# EasyEDA Pro project climbsnail-spotwelder-45c7d2f7.epro, board 大号mos板_8管
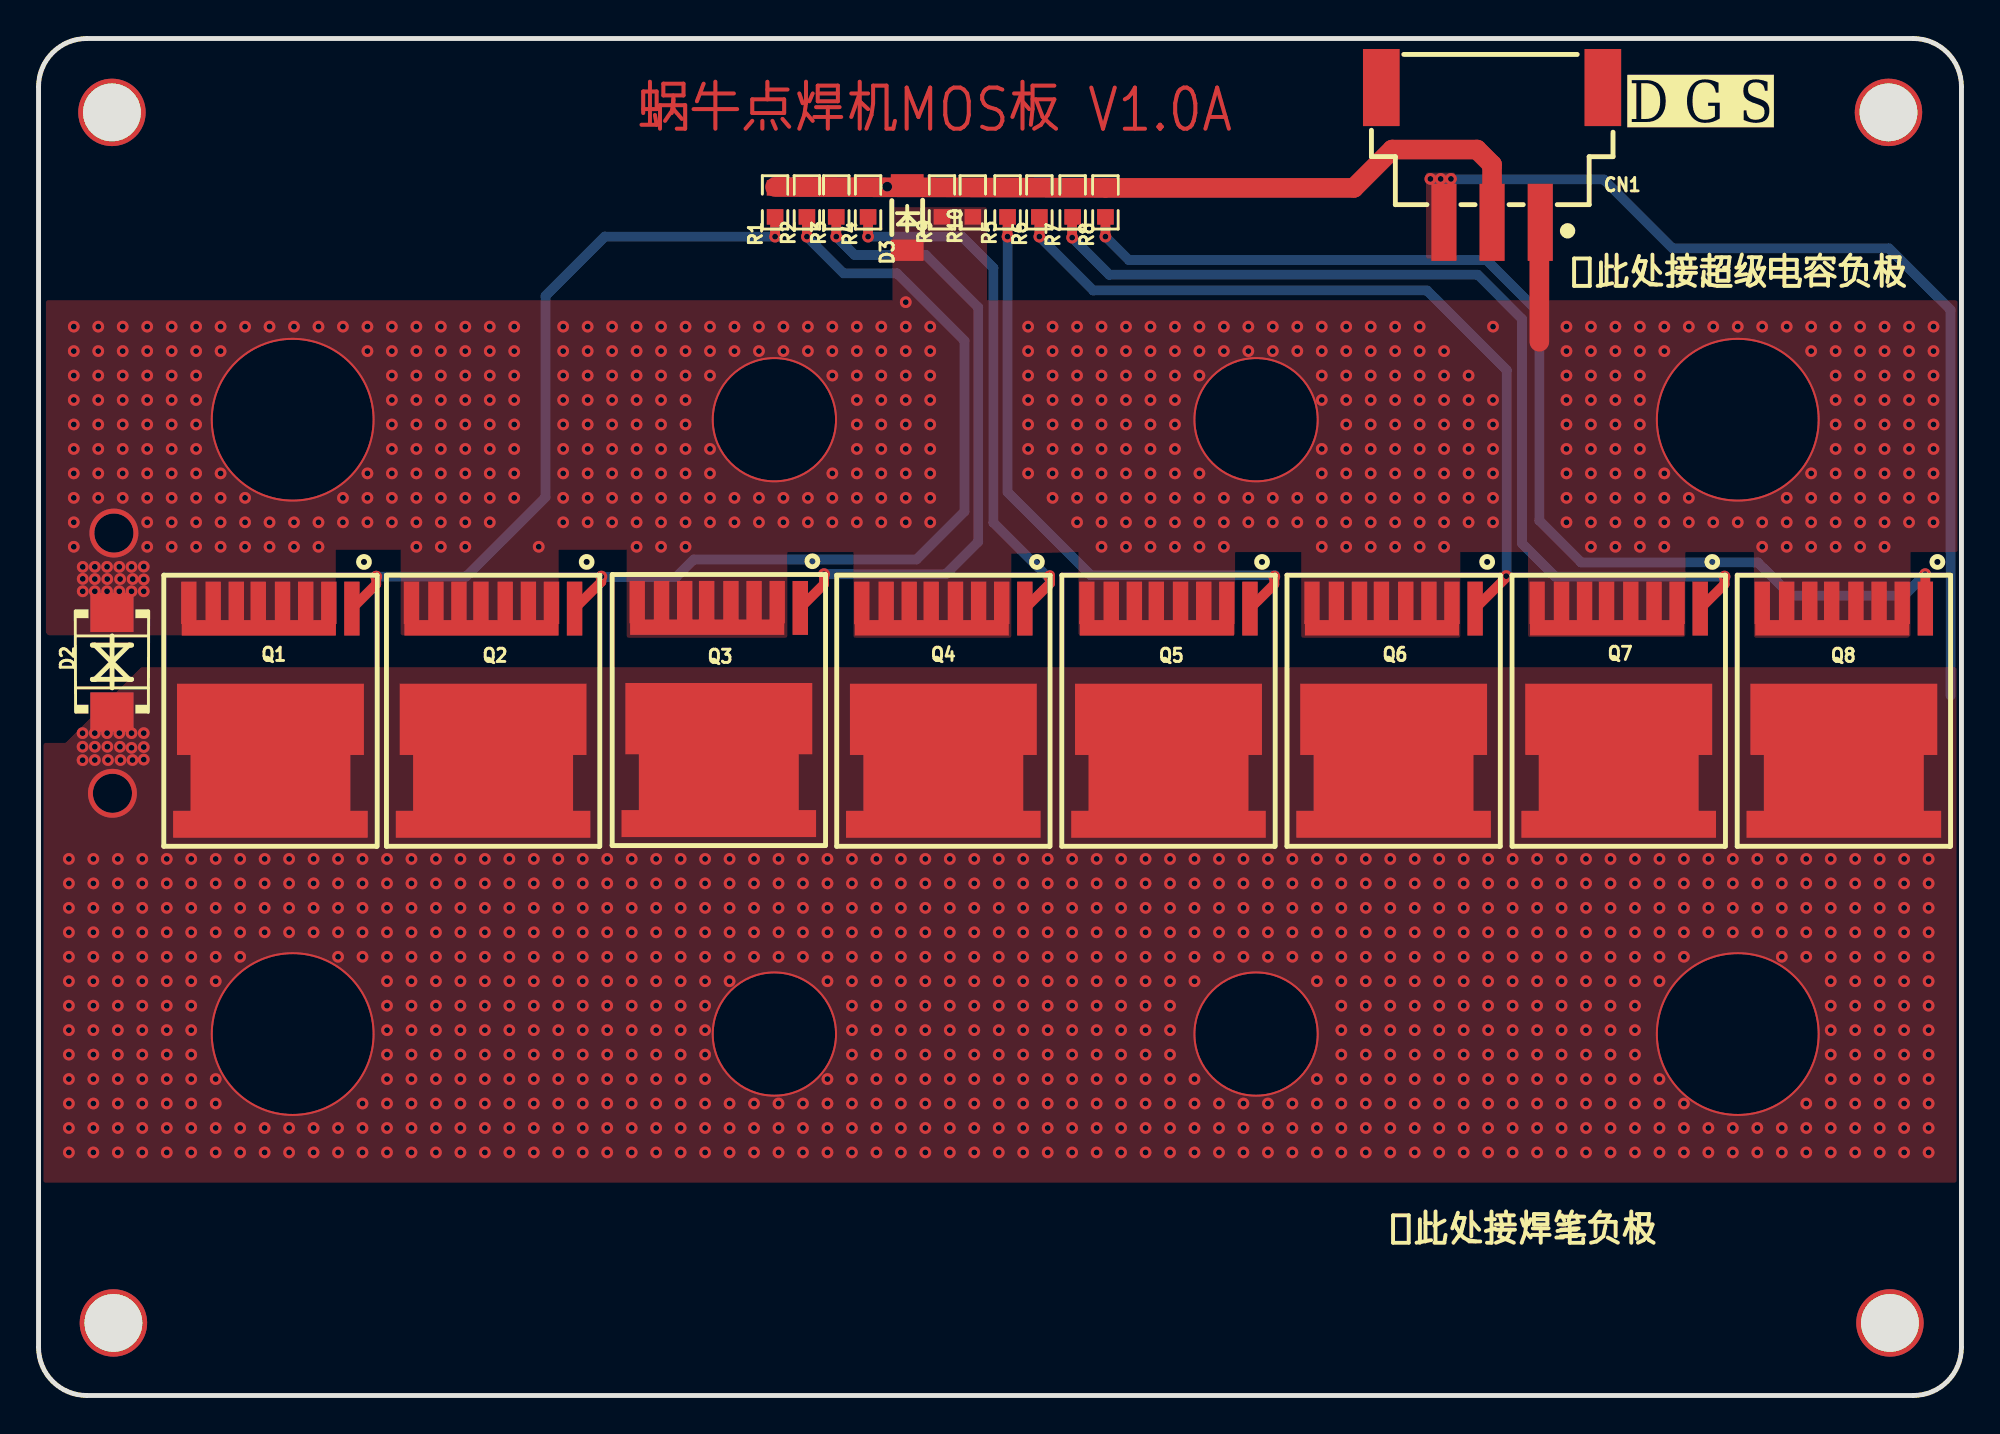
[diagram p10: board, top side]
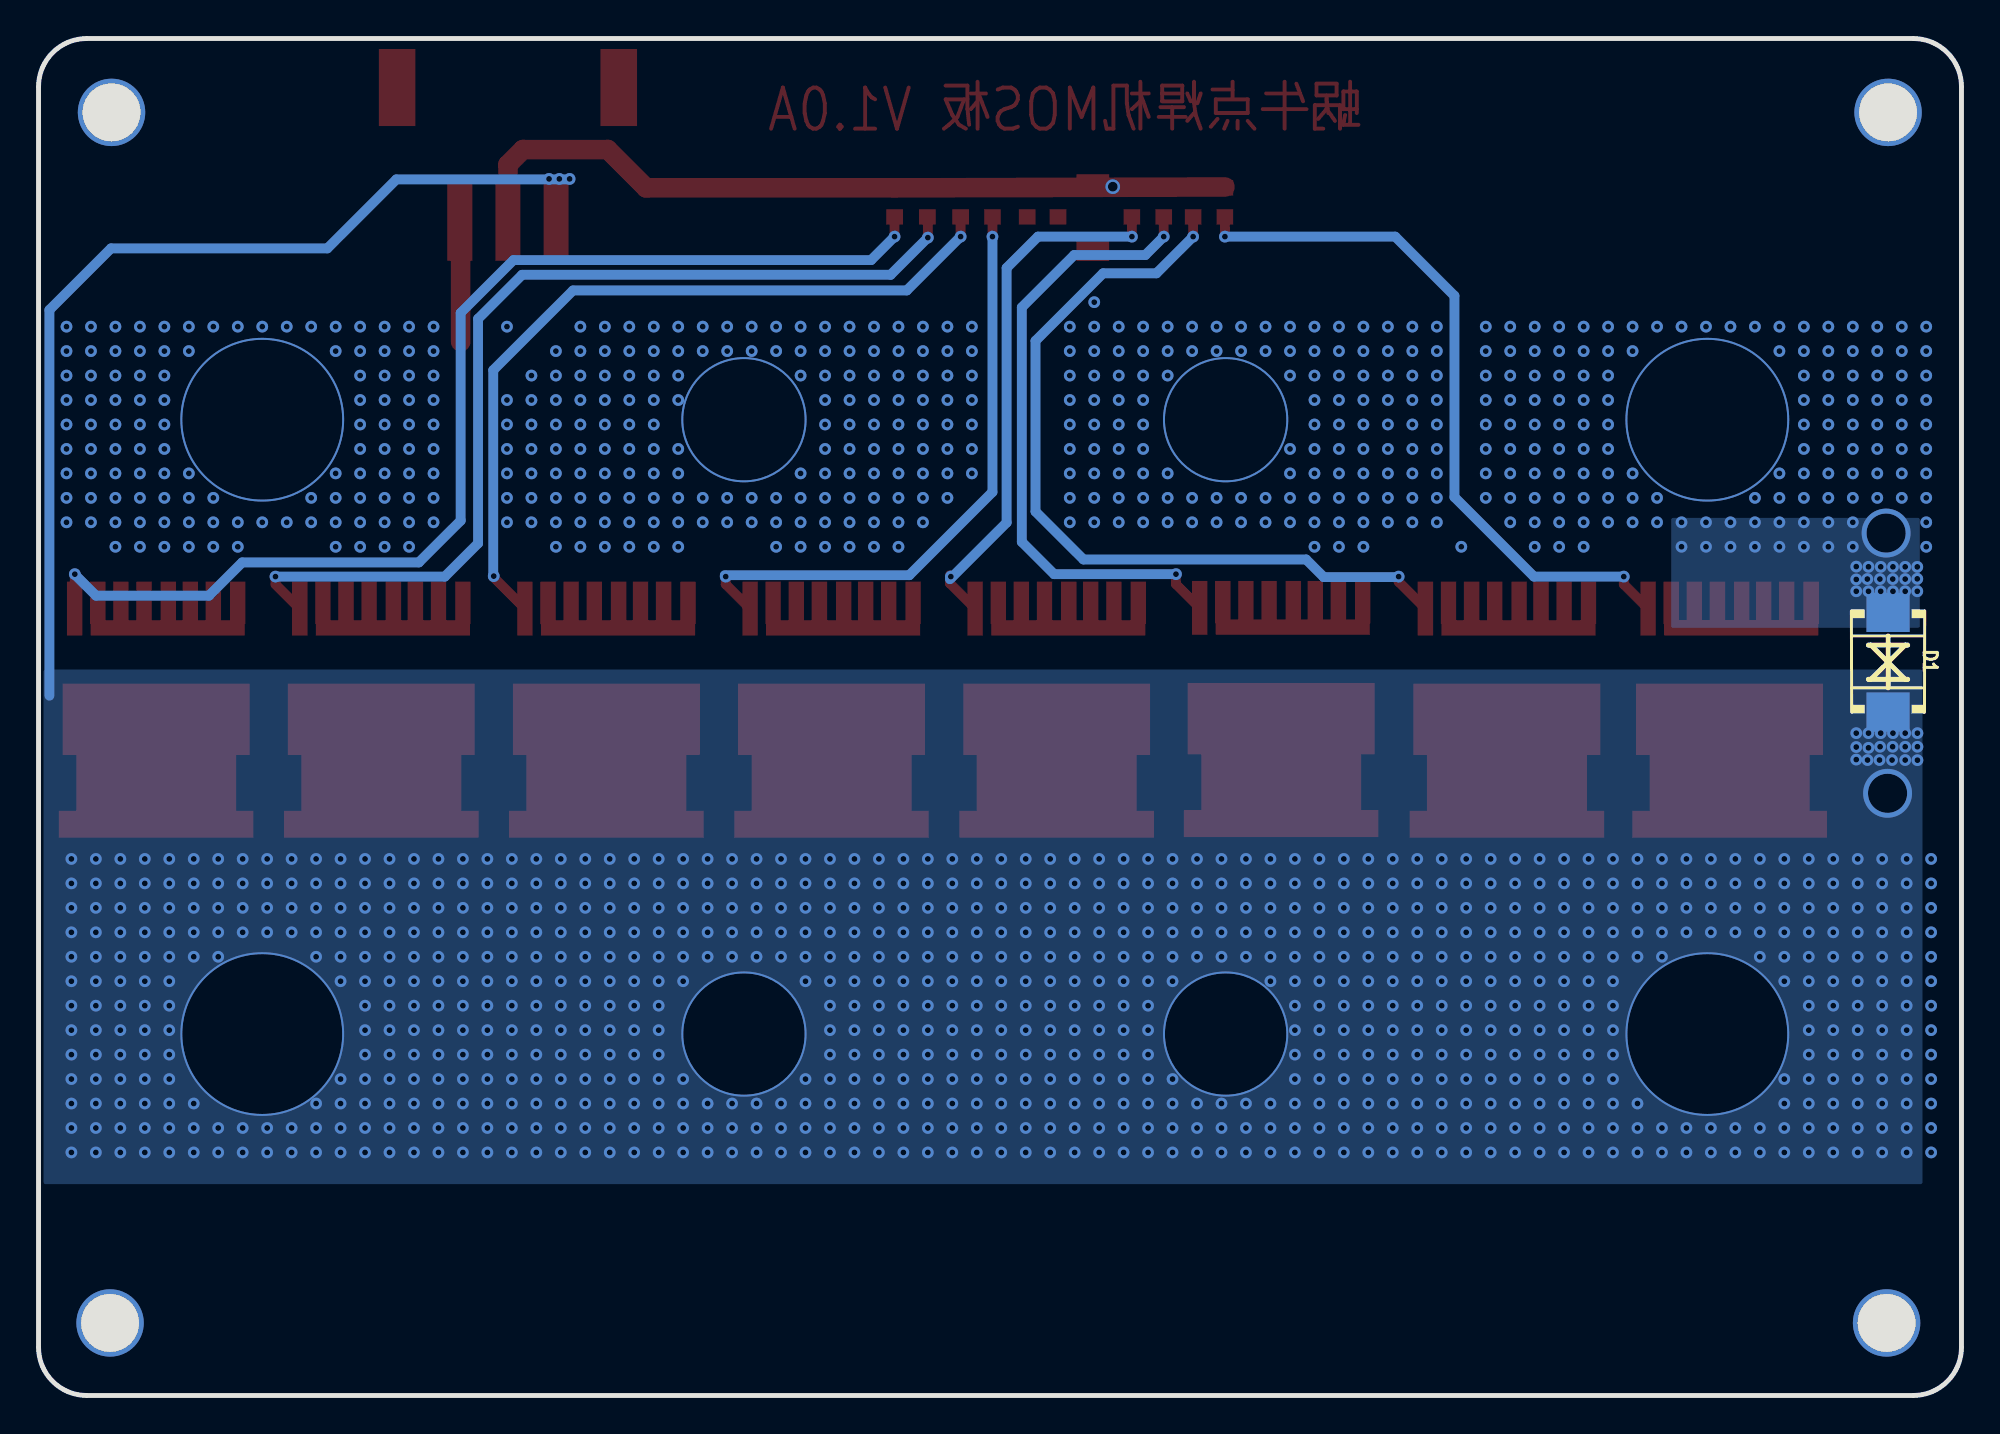
[diagram p11: board, bottom side, seen from below]

Outline 99.8 x 70.46 mm; copper layers: Top Layer, Bottom Layer. Coordinates in mm from the lower left corner of the outline.
Outline path: 0,67.96 0,2.5 arc(0.73,0.73) 2.5,0 97.3,0 arc(99.07,0.73) 99.8,2.5 99.8,67.96 arc(99.07,69.73) 97.3,70.46 2.5,70.46 arc(0.73,69.73) 0,67.96
Stack: Top Layer 0.035mm / Dielectric1 1.51mm FR4 er 4.5 / Bottom Layer 0.035mm

## Design rules (mm)
spacing safeClearance (default): track to track 0.152, other pairs 0.152 to 0.3
spacing Plane_innerPlane: track to track 0.152, other pairs 0.152 to 0.3
spacing Copper_copperRegion: track to track 0.152, other pairs 0.152 to 0.3
spacing Copper_GND: track to track 0.152, other pairs 0.152 to 0.3
track width trackWidth (default): min 0.127, default 0.254, max 2.54
differential pair differentialPair (default): width min 0.127, default 0.254, max 2.54; gap min 0.152, default 0.152
net GND uses GND
pour e1508 uses Copper_GND, copperRegion_Copper_GND
pour e1510 uses Copper_GND, copperRegion_Copper_GND
pour e1512 uses Copper_copperRegion, copperRegion_Copper_copperRegion
pour e1514 uses Copper_copperRegion, copperRegion_Copper_copperRegion
pour e1516 uses Copper_copperRegion, copperRegion_Copper_copperRegion
pour e1518 uses Copper_GND, copperRegion_Copper_GND

## Placement (name value [footprint] x y rotation side)
CN1  XH2.54-3P  [CONN-SMD_3P-P2.50-WT]  75.44 64.41 180 top
D1  SMBJ28CA双向TVS管  [SMB_L4.6-W3.6-LS5.3-BI]  3.81 38.07 90 bottom
D2  SMBJ28CA双向TVS管  [SMB_L4.6-W3.6-LS5.3-BI]  3.81 38.07 90 top
D3  ZMM18  [LL-34_L3.5-W1.5-RD]  45.09 61.16 270 top
NOREF  -  [Pad_e1476]  96.09 3.77 0 top
NOREF#2  -  [Pad_e1478]  3.81 66.62 0 top
NOREF#3  -  [Pad_e1475]  96.01 66.62 0 top
NOREF#4  -  [Pad_e1477]  3.89 3.77 0 top
Q1  IPLU300N04S4  [HSOF-8_L10.0-W10.5-P1.20_1]  12.06 37.06 180 top
Q2  IPLU300N04S4  [HSOF-8_L10.0-W10.5-P1.20_1]  23.62 37.06 180 top
Q3  IPLU300N04S4  [HSOF-8_L10.0-W10.5-P1.20_1]  35.34 37.09 180 top
Q4  IPLU300N04S4  [HSOF-8_L10.0-W10.5-P1.20_1]  46.99 37.06 180 top
Q5  IPLU300N04S4  [HSOF-8_L10.0-W10.5-P1.20_1]  58.67 37.06 180 top
Q6  IPLU300N04S4  [HSOF-8_L10.0-W10.5-P1.20_1]  70.36 37.06 180 top
Q7  IPLU300N04S4  [HSOF-8_L10.0-W10.5-P1.20_1]  82.04 37.06 180 top
Q8  IPLU300N04S4  [HSOF-8_L10.0-W10.5-P1.20_1]  93.73 37.06 180 top
R1  20R  [R0603]  38.23 61.95 270 top
R2  20R  [R0603]  39.88 61.95 270 top
R3  20R  [R0603]  41.4 61.95 270 top
R4  20R  [R0603]  43.05 61.95 270 top
R5  20R  [R0603]  50.29 61.95 270 top
R6  20R  [R0603]  51.94 61.95 270 top
R7  20R  [R0603]  53.67 61.95 270 top
R8  20R  [R0603]  55.37 61.95 270 top
R9  10K  [R0603]  46.89 61.95 90 top
R10  10K  [R0603]  48.49 61.95 90 top

## Footprints (pads in the part's own frame, mm; a bottom-side part is the same pattern mirrored in y, then rotated)
CONN-SMD_3P-P2.50-WT
  rect 1.3x4 smd: 1(-2.499,3.5) 2(0,3.5) 3(2.499,3.5)
  rect 1.9x4 smd: 4(-5.75,-3.5) 5(5.75,-3.5)
HSOF-8_L10.0-W10.5-P1.20_1
  rect 0.8x2.799 smd: 1(-4.199,-3.8)
  rect 0.8x2.2 smd: 2(-2.999,-4.099) 3(-1.801,-4.099) 4(-0.6,-4.099) 6(1.801,-4.099) 7(2.999,-4.099)
  rect 8.001x0.8 smd: 2(0.632,-2.801)
  custom 0x0 smd: 5(0.6,-4.072) 8(4.201,-4.072) 9(0.03,4.099)
LL-34_L3.5-W1.5-RD
  rect 1.1x1.7 smd: 1(-1.7,0) 2(1.7,0)
Pad_e1475
  round 3.5 hole 3: 1(0,0)
Pad_e1476
  round 3.5 hole 3: 1(0,0)
Pad_e1477
  round 3.5 hole 3: 1(0,0)
Pad_e1478
  round 3.5 hole 3: 1(0,0)
R0603
  rect 0.806x0.864 smd: 1(-0.753,0) 2(0.753,0)
SMB_L4.6-W3.6-LS5.3-BI
  rect 2.047x2.241 smd: 1(-2.591,0) 2(2.591,0)

## Nets
As in the schematic.

Pads without a net: CN1 4 5; NOREF 1; NOREF#2 1; NOREF#3 1; NOREF#4 1

## Via types
v1: diameter 0.61, hole 0.305, Top Layer to Bottom Layer, 1463 vias
v2: diameter 6.5, hole 6.3, Top Layer to Bottom Layer, 4 vias
v3: diameter 8.5, hole 8.3, Top Layer to Bottom Layer, 4 vias
v4: diameter 2.54, hole 2.032, Top Layer to Bottom Layer, 2 vias
v5: diameter 0.762, hole 0.508, Top Layer to Bottom Layer, 1 via

## Routing (per net, layer and track width the routed paths; a pad name or vN(x,y) marks a point on that pad's centre or on a via; arc(x,y) is an arc through that point)
GND:
  vias: v1(1.83,55.5) v1(1.83,54.23) v1(1.83,52.96) v1(1.83,51.69) v1(1.83,50.42) v1(1.83,49.15) v1(1.83,47.88) v1(1.83,46.61) v1(1.83,45.34) v1(1.83,44.07) v1(2.29,43.02) v1(2.29,42.4) v1(2.29,41.76) v1(2.92,43.03) v1(2.92,42.39) v1(2.92,41.76) v1(3.1,55.5) v1(3.1,54.23) v1(3.1,52.96) v1(3.1,51.69) v1(3.1,50.42) v1(3.1,49.15) v1(3.1,47.88) v1(3.1,46.61) v1(3.56,43.03) v1(3.57,42.39) v1(3.56,41.76) v1(4.19,43.03) v1(4.23,42.39) v1(4.19,41.76) v1(4.37,55.5) v1(4.37,54.23) v1(4.37,52.96) v1(4.37,51.69) v1(4.37,50.42) v1(4.37,49.15) v1(4.37,47.88) v1(4.37,46.61) v1(4.83,43.03) v1(4.83,41.76) v1(4.89,42.39) v1(5.46,43.04) v1(5.46,42.37) v1(5.46,41.76) v1(5.64,55.5) v1(5.64,54.23) v1(5.64,52.96) v1(5.64,51.69) v1(5.64,50.42) v1(5.64,49.15) v1(5.64,47.88) v1(5.64,46.61) v1(5.64,45.34) v1(5.64,44.07) v1(6.91,55.5) v1(6.91,54.23) v1(6.91,52.96) v1(6.91,51.69) v1(6.91,50.42) v1(6.91,49.15) v1(6.91,47.88) v1(6.91,46.61) v1(6.91,45.34) v1(6.91,44.07) v1(8.18,55.5) v1(8.18,54.23) v1(8.18,52.96) v1(8.18,51.69) v1(8.18,50.42) v1(8.18,49.15) v1(8.18,47.88) v1(8.18,46.61) v1(8.18,45.34) v1(8.18,44.07) v1(9.45,55.5) v1(9.45,54.23) v1(9.45,47.88) v1(9.45,46.61) v1(9.45,45.34) v1(9.45,44.07) v1(10.72,55.5) v1(10.72,46.61) v1(10.72,45.34) v1(10.72,44.07) v1(11.99,55.5) v1(11.99,45.34) v1(11.99,44.07) v1(13.26,55.5) v1(13.26,45.34) v1(13.26,44.07) v1(14.53,55.5) v1(14.53,45.34) v1(14.53,44.07) v1(15.8,55.5) v1(15.8,46.61) v1(15.8,45.34) v1(17.07,55.5) v1(17.07,54.23) v1(17.07,47.88) v1(17.07,46.61) v1(17.07,45.34) v1(18.34,55.5) v1(18.34,54.23) v1(18.34,52.96) v1(18.34,51.69) v1(18.34,50.42) v1(18.34,49.15) v1(18.34,47.88) v1(18.34,46.61) v1(18.34,45.34) v1(19.61,55.5) v1(19.61,54.23) v1(19.61,52.96) v1(19.61,51.69) v1(19.61,50.42) v1(19.61,49.15) v1(19.61,47.88) v1(19.61,46.61) v1(19.61,45.34) v1(19.61,44.07) v1(20.88,55.5) v1(20.88,54.23) v1(20.88,52.96) v1(20.88,51.69) v1(20.88,50.42) v1(20.88,49.15) v1(20.88,47.88) v1(20.88,46.61) v1(20.88,45.34) v1(20.88,44.07) v1(22.15,55.5) v1(22.15,54.23) v1(22.15,52.96) v1(22.15,51.69) v1(22.15,50.42) v1(22.15,49.15) v1(22.15,47.88) v1(22.15,46.61) v1(22.15,45.34) v1(22.15,44.07) v1(23.42,55.5) v1(23.42,54.23) v1(23.42,52.96) v1(23.42,51.69) v1(23.42,50.42) v1(23.42,49.15) v1(23.42,47.88) v1(23.42,46.61) v1(23.42,45.34) v1(24.69,55.5) v1(24.69,54.23) v1(24.69,52.96) v1(24.69,51.69) v1(24.69,50.42) v1(24.69,49.15) v1(24.69,47.88) v1(24.69,46.61) v1(25.96,44.07) v1(27.23,55.5) v1(27.23,54.23) v1(27.23,52.96) v1(27.23,51.69) v1(27.23,50.42) v1(27.23,49.15) v1(27.23,47.88) v1(27.23,46.61) v1(27.23,45.34) v1(28.5,55.5) v1(28.5,54.23) v1(28.5,52.96) v1(28.5,51.69) v1(28.5,50.42) v1(28.5,49.15) v1(28.5,47.88) v1(28.5,46.61) v1(28.5,45.34) v1(29.77,55.5) v1(29.77,54.23) v1(29.77,52.96) v1(29.77,51.69) v1(29.77,50.42) v1(29.77,49.15) v1(29.77,47.88) v1(29.77,46.61) v1(29.77,45.34) v1(31.04,55.5) v1(31.04,54.23) v1(31.04,52.96) v1(31.04,51.69) v1(31.04,50.42) v1(31.04,49.15) v1(31.04,47.88) v1(31.04,46.61) v1(31.04,45.34) v1(31.04,44.07) v1(32.31,55.5) v1(32.31,54.23) v1(32.31,52.96) v1(32.31,51.69) v1(32.31,50.42) v1(32.31,49.15) v1(32.31,47.88) v1(32.31,46.61) v1(32.31,45.34) v1(32.31,44.07) v1(33.58,55.5) v1(33.58,54.23) v1(33.58,52.96) v1(33.58,51.69) v1(33.58,50.42) v1(33.58,49.15) v1(33.58,47.88) v1(33.58,46.61) v1(33.58,45.34) v1(33.58,44.07) v1(34.85,55.5) v1(34.85,54.23) v1(34.85,52.96) v1(34.85,49.15) v1(34.85,47.88) v1(34.85,46.61) v1(34.85,45.34) v1(36.12,55.5) v1(36.12,54.23) v1(36.12,46.61) v1(36.12,45.34) v1(37.39,55.5) v1(37.39,54.23) v1(37.39,46.61) v1(37.39,45.34) v1(38.66,55.5) v1(38.66,54.23) v1(38.66,46.61) v1(38.66,45.34) v1(39.93,55.5) v1(39.93,54.23) v1(39.93,46.61) v1(39.93,45.34) v1(41.2,55.5) v1(41.2,54.23) v1(41.2,52.96) v1(41.2,47.88) v1(41.2,46.61) v1(41.2,45.34) v1(42.47,55.5) v1(42.47,54.23) v1(42.47,52.96) v1(42.47,51.69) v1(42.47,50.42) v1(42.47,49.15) v1(42.47,47.88) v1(42.47,46.61) v1(42.47,45.34) v1(43.74,55.5) v1(43.74,54.23) v1(43.74,52.96) v1(43.74,51.69) v1(43.74,50.42) v1(43.74,49.15) v1(43.74,47.88) v1(43.74,46.61) v1(43.74,45.34) v1(45.01,56.77) v1(45.01,55.5) v1(45.01,54.23) v1(45.01,52.96) v1(45.01,51.69) v1(45.01,50.42) v1(45.01,49.15) v1(45.01,47.88) v1(45.01,46.61) v1(45.01,45.34) v1(46.28,55.5) v1(46.28,54.23) v1(46.28,52.96) v1(46.28,51.69) v1(46.28,50.42) v1(46.28,49.15) v1(46.28,47.88) v1(46.28,46.61) v1(46.28,45.34) v1(51.36,55.5) v1(51.36,54.23) v1(51.36,52.96) v1(51.36,51.69) v1(51.36,50.42) v1(51.36,49.15) v1(51.36,47.88) v1(52.63,55.5) v1(52.63,54.23) v1(52.63,52.96) v1(52.63,51.69) v1(52.63,50.42) v1(52.63,49.15) v1(52.63,47.88) v1(52.63,46.61) v1(53.9,55.5) v1(53.9,54.23) v1(53.9,52.96) v1(53.9,51.69) v1(53.9,50.42) v1(53.9,49.15) v1(53.9,47.88) v1(53.9,46.61) v1(53.9,45.34) v1(55.17,55.5) v1(55.17,54.23) v1(55.17,52.96) v1(55.17,51.69) v1(55.17,50.42) v1(55.17,49.15) v1(55.17,47.88) v1(55.17,46.61) v1(55.17,45.34) v1(55.17,44.07) v1(56.44,55.5) v1(56.44,54.23) v1(56.44,52.96) v1(56.44,51.69) v1(56.44,50.42) v1(56.44,49.15) v1(56.44,47.88) v1(56.44,46.61) v1(56.44,45.34) v1(56.44,44.07) v1(57.71,55.5) v1(57.71,54.23) v1(57.71,52.96) v1(57.71,51.69) v1(57.71,50.42) v1(57.71,49.15) v1(57.71,47.88) v1(57.71,46.61) v1(57.71,45.34) v1(57.71,44.07) v1(58.98,55.5) v1(58.98,54.23) v1(58.98,52.96) v1(58.98,51.69) v1(58.98,50.42) v1(58.98,49.15) v1(58.98,47.88) v1(58.98,46.61) v1(58.98,45.34) v1(58.98,44.07) v1(60.25,55.5) v1(60.25,54.23) v1(60.25,52.96) v1(60.25,47.88) v1(60.25,46.61) v1(60.25,45.34) v1(60.25,44.07) v1(61.52,55.5) v1(61.52,54.23) v1(61.52,46.61) v1(61.52,45.34) v1(61.52,44.07) v1(62.79,55.5) v1(62.79,54.23) v1(62.79,46.61) v1(62.79,45.34) v1(64.06,55.5) v1(64.06,54.23) v1(64.06,46.61) v1(64.06,45.34) v1(65.33,55.5) v1(65.33,54.23) v1(65.33,46.61) v1(65.33,45.34) v1(66.6,55.5) v1(66.6,54.23) v1(66.6,52.96) v1(66.6,51.69) v1(66.6,49.15) v1(66.6,47.88) v1(66.6,46.61) v1(66.6,45.34) v1(66.6,44.07) v1(67.87,55.5) v1(67.87,54.23) v1(67.87,52.96) v1(67.87,51.69) v1(67.87,50.42) v1(67.87,49.15) v1(67.87,47.88) v1(67.87,46.61) v1(67.87,45.34) v1(67.87,44.07) v1(69.14,55.5) v1(69.14,54.23) v1(69.14,52.96) v1(69.14,51.69) v1(69.14,50.42) v1(69.14,49.15) v1(69.14,47.88) v1(69.14,46.61) v1(69.14,45.34) v1(69.14,44.07) v1(70.41,55.5) v1(70.41,54.23) v1(70.41,52.96) v1(70.41,51.69) v1(70.41,50.42) v1(70.41,49.15) v1(70.41,47.88) v1(70.41,46.61) v1(70.41,45.34) v1(70.41,44.07) v1(71.68,55.5) v1(71.68,54.23) v1(71.68,52.96) v1(71.68,51.69) v1(71.68,50.42) v1(71.68,49.15) v1(71.68,47.88) v1(71.68,46.61) v1(71.68,45.34) v1(71.68,44.07) v1(72.95,54.23) v1(72.95,52.96) v1(72.95,51.69) v1(72.95,50.42) v1(72.95,49.15) v1(72.95,47.88) v1(72.95,46.61) v1(72.95,45.34) v1(72.95,44.07) v1(74.22,52.96) v1(74.22,51.69) v1(74.22,50.42) v1(74.22,49.15) v1(74.22,47.88) v1(74.22,46.61) v1(74.22,45.34) v1(75.49,55.5) v1(75.49,51.69) v1(75.49,50.42) v1(75.49,49.15) v1(75.49,47.88) v1(75.49,46.61) v1(75.49,45.34) v1(79.3,55.5) v1(79.3,54.23) v1(79.3,52.96) v1(79.3,51.69) v1(79.3,50.42) v1(79.3,49.15) v1(79.3,47.88) v1(79.3,46.61) v1(79.3,45.34) v1(80.57,55.5) v1(80.57,54.23) v1(80.57,52.96) v1(80.57,51.69) v1(80.57,50.42) v1(80.57,49.15) v1(80.57,47.88) v1(80.57,46.61) v1(80.57,45.34) v1(80.57,44.07) v1(81.84,55.5) v1(81.84,54.23) v1(81.84,52.96) v1(81.84,51.69) v1(81.84,50.42) v1(81.84,49.15) v1(81.84,47.88) v1(81.84,46.61) v1(81.84,45.34) v1(81.84,44.07) v1(83.11,55.5) v1(83.11,54.23) v1(83.11,52.96) v1(83.11,51.69) v1(83.11,50.42) v1(83.11,49.15) v1(83.11,47.88) v1(83.11,46.61) v1(83.11,45.34) v1(83.11,44.07) v1(84.38,55.5) v1(84.38,54.23) v1(84.38,47.88) v1(84.38,46.61) v1(84.38,45.34) v1(84.38,44.07) v1(85.65,55.5) v1(85.65,46.61) v1(85.65,45.34) v1(86.92,55.5) v1(86.92,45.34) v1(88.19,55.5) v1(88.19,45.34) v1(89.46,55.5) v1(89.46,45.34) v1(89.46,44.07) v1(90.73,55.5) v1(90.73,46.61) v1(90.73,45.34) v1(90.73,44.07) v1(92,55.5) v1(92,54.23) v1(92,47.88) v1(92,46.61) v1(92,45.34) v1(92,44.07) v1(93.27,55.5) v1(93.27,54.23) v1(93.27,52.96) v1(93.27,51.69) v1(93.27,50.42) v1(93.27,49.15) v1(93.27,47.88) v1(93.27,46.61) v1(93.27,45.34) v1(93.27,44.07) v1(94.54,55.5) v1(94.54,54.23) v1(94.54,52.96) v1(94.54,51.69) v1(94.54,50.42) v1(94.54,49.15) v1(94.54,47.88) v1(94.54,46.61) v1(94.54,45.34) v1(94.54,44.07) v1(95.81,55.5) v1(95.81,54.23) v1(95.81,52.96) v1(95.81,51.69) v1(95.81,50.42) v1(95.81,49.15) v1(95.81,47.88) v1(95.81,46.61) v1(95.81,45.34) v1(95.81,44.07) v1(97.08,55.5) v1(97.08,54.23) v1(97.08,52.96) v1(97.08,51.69) v1(97.08,50.42) v1(97.08,49.15) v1(97.08,47.88) v1(97.08,46.61) v1(97.08,45.34) v1(98.35,55.5) v1(98.35,54.23) v1(98.35,52.96) v1(98.35,51.69) v1(98.35,50.42) v1(98.35,49.15) v1(98.35,47.88) v1(98.35,46.61) v1(98.35,45.34) v2(38.19,50.67) v2(63.19,50.67) v3(13.19,50.67) v3(88.19,50.67) v4(3.91,44.78)
MOS_D:
  vias: v1(1.58,27.86) v1(1.58,26.59) v1(1.58,25.32) v1(1.58,24.05) v1(1.58,22.78) v1(1.58,21.51) v1(1.58,20.24) v1(1.58,18.97) v1(1.58,17.7) v1(1.58,16.43) v1(1.58,15.16) v1(1.58,13.89) v1(1.58,12.62) v1(2.29,34.39) v1(2.29,33.69) v1(2.29,32.99) v1(2.92,34.39) v1(2.92,33.69) v1(2.92,32.99) v1(2.84,27.86) v1(2.84,26.59) v1(2.84,25.32) v1(2.84,24.05) v1(2.84,22.78) v1(2.84,21.51) v1(2.84,20.24) v1(2.84,18.97) v1(2.84,17.7) v1(2.84,16.43) v1(2.84,15.16) v1(2.84,13.89) v1(2.84,12.62) v1(3.56,34.39) v1(3.57,33.69) v1(3.6,32.99) v1(4.11,27.86) v1(4.11,26.59) v1(4.11,25.32) v1(4.11,24.05) v1(4.11,22.78) v1(4.11,21.51) v1(4.11,20.24) v1(4.11,18.97) v1(4.11,17.7) v1(4.11,16.43) v1(4.11,15.16) v1(4.11,13.89) v1(4.11,12.62) v1(4.19,34.39) v1(4.22,33.69) v1(4.25,32.99) v1(4.83,34.39) v1(4.83,33.63) v1(4.88,32.99) v1(5.38,27.86) v1(5.38,26.59) v1(5.38,25.32) v1(5.38,24.05) v1(5.38,22.78) v1(5.38,21.51) v1(5.38,20.24) v1(5.38,18.97) v1(5.38,17.7) v1(5.38,16.43) v1(5.38,15.16) v1(5.38,13.89) v1(5.38,12.62) v1(5.46,34.39) v1(5.46,33.67) v1(5.46,33.02) v1(6.66,27.86) v1(6.66,26.59) v1(6.66,25.32) v1(6.66,24.05) v1(6.66,22.78) v1(6.66,21.51) v1(6.66,20.24) v1(6.66,18.97) v1(6.66,17.7) v1(6.66,16.43) v1(6.66,15.16) v1(6.66,13.89) v1(6.66,12.62) v1(7.92,27.86) v1(7.92,26.59) v1(7.92,25.32) v1(7.92,24.05) v1(7.92,22.78) v1(7.92,21.51) v1(7.92,20.24) v1(7.92,18.97) v1(7.92,17.7) v1(7.92,16.43) v1(7.92,15.16) v1(7.92,13.89) v1(7.92,12.62) v1(9.19,27.86) v1(9.19,26.59) v1(9.19,25.32) v1(9.19,24.05) v1(9.19,22.78) v1(9.19,21.51) v1(9.19,16.43) v1(9.19,15.16) v1(9.19,13.89) v1(9.19,12.62) v1(10.47,27.86) v1(10.47,26.59) v1(10.47,25.32) v1(10.47,24.05) v1(10.47,22.78) v1(10.47,13.89) v1(10.47,12.62) v1(11.73,27.86) v1(11.73,26.59) v1(11.73,25.32) v1(11.73,24.05) v1(11.73,13.89) v1(11.73,12.62) v1(13,27.86) v1(13,26.59) v1(13,25.32) v1(13,24.05) v1(13,13.89) v1(13,12.62) v1(14.27,27.86) v1(14.27,26.59) v1(14.27,25.32) v1(14.27,24.05) v1(14.27,13.89) v1(14.27,12.62) v1(15.55,27.86) v1(15.55,26.59) v1(15.55,25.32) v1(15.55,24.05) v1(15.55,22.78) v1(15.55,13.89) v1(15.55,12.62) v1(16.81,27.86) v1(16.81,26.59) v1(16.81,25.32) v1(16.81,24.05) v1(16.81,22.78) v1(16.81,15.16) v1(16.81,13.89) v1(16.81,12.62) v1(18.08,27.86) v1(18.08,26.59) v1(18.08,25.32) v1(18.08,24.05) v1(18.08,22.78) v1(18.08,21.51) v1(18.08,20.24) v1(18.08,18.97) v1(18.08,17.7) v1(18.08,16.43) v1(18.08,15.16) v1(18.08,13.89) v1(18.08,12.62) v1(19.36,27.86) v1(19.36,26.59) v1(19.36,25.32) v1(19.36,24.05) v1(19.36,22.78) v1(19.36,21.51) v1(19.36,20.24) v1(19.36,18.97) v1(19.36,17.7) v1(19.36,16.43) v1(19.36,15.16) v1(19.36,13.89) v1(19.36,12.62) v1(20.62,27.86) v1(20.62,26.59) v1(20.62,25.32) v1(20.62,24.05) v1(20.62,22.78) v1(20.62,21.51) v1(20.62,20.24) v1(20.62,18.97) v1(20.62,17.7) v1(20.62,16.43) v1(20.62,15.16) v1(20.62,13.89) v1(20.62,12.62) v1(21.89,27.86) v1(21.89,26.59) v1(21.89,25.32) v1(21.89,24.05) v1(21.89,22.78) v1(21.89,21.51) v1(21.89,20.24) v1(21.89,18.97) v1(21.89,17.7) v1(21.89,16.43) v1(21.89,15.16) v1(21.89,13.89) v1(21.89,12.62) v1(23.16,27.86) v1(23.16,26.59) v1(23.16,25.32) v1(23.16,24.05) v1(23.16,22.78) v1(23.16,21.51) v1(23.16,20.24) v1(23.16,18.97) v1(23.16,17.7) v1(23.16,16.43) v1(23.16,15.16) v1(23.16,13.89) v1(23.16,12.62) v1(24.44,27.86) v1(24.44,26.59) v1(24.44,25.32) v1(24.44,24.05) v1(24.44,22.78) v1(24.44,21.51) v1(24.44,20.24) v1(24.44,18.97) v1(24.44,17.7) v1(24.44,16.43) v1(24.44,15.16) v1(24.44,13.89) v1(24.44,12.62) v1(25.7,27.86) v1(25.7,26.59) v1(25.7,25.32) v1(25.7,24.05) v1(25.7,22.78) v1(25.7,21.51) v1(25.7,20.24) v1(25.7,18.97) v1(25.7,17.7) v1(25.7,16.43) v1(25.7,15.16) v1(25.7,13.89) v1(25.7,12.62) v1(26.97,27.86) v1(26.97,26.59) v1(26.97,25.32) v1(26.97,24.05) v1(26.97,22.78) v1(26.97,21.51) v1(26.97,20.24) v1(26.97,18.97) v1(26.97,17.7) v1(26.97,16.43) v1(26.97,15.16) v1(26.97,13.89) v1(26.97,12.62) v1(28.25,27.86) v1(28.25,26.59) v1(28.25,25.32) v1(28.25,24.05) v1(28.25,22.78) v1(28.25,21.51) v1(28.25,20.24) v1(28.25,18.97) v1(28.25,17.7) v1(28.25,16.43) v1(28.25,15.16) v1(28.25,13.89) v1(28.25,12.62) v1(29.52,27.86) v1(29.52,26.59) v1(29.52,25.32) v1(29.52,24.05) v1(29.52,22.78) v1(29.52,21.51) v1(29.52,20.24) v1(29.52,18.97) v1(29.52,17.7) v1(29.52,16.43) v1(29.52,15.16) v1(29.52,13.89) v1(29.52,12.62) v1(30.78,27.86) v1(30.78,26.59) v1(30.78,25.32) v1(30.78,24.05) v1(30.78,22.78) v1(30.78,21.51) v1(30.78,20.24) v1(30.78,18.97) v1(30.78,17.7) v1(30.78,16.43) v1(30.78,15.16) v1(30.78,13.89) v1(30.78,12.62) v1(32.05,27.86) v1(32.05,26.59) v1(32.05,25.32) v1(32.05,24.05) v1(32.05,22.78) v1(32.05,21.51) v1(32.05,20.24) v1(32.05,18.97) v1(32.05,17.7) v1(32.05,16.43) v1(32.05,15.16) v1(32.05,13.89) v1(32.05,12.62) v1(33.33,27.86) v1(33.33,26.59) v1(33.33,25.32) v1(33.33,24.05) v1(33.33,22.78) v1(33.33,21.51) v1(33.33,20.24) v1(33.33,18.97) v1(33.33,17.7) v1(33.33,16.43) v1(33.33,15.16) v1(33.33,13.89) v1(33.33,12.62) v1(34.59,27.86) v1(34.59,26.59) v1(34.59,25.32) v1(34.59,24.05) v1(34.59,22.78) v1(34.59,21.51) v1(34.59,20.24) v1(34.59,18.97) v1(34.59,17.7) v1(34.59,16.43) v1(34.59,15.16) v1(34.59,13.89) v1(34.59,12.62) v1(35.87,27.86) v1(35.87,26.59) v1(35.87,25.32) v1(35.87,24.05) v1(35.87,22.78) v1(35.87,21.51) v1(35.87,15.16) v1(35.87,13.89) v1(35.87,12.62) v1(37.13,27.86) v1(37.13,26.59) v1(37.13,25.32) v1(37.13,24.05) v1(37.13,22.78) v1(37.13,15.16) v1(37.13,13.89) v1(37.13,12.62) v1(38.41,27.86) v1(38.41,26.59) v1(38.41,25.32) v1(38.41,24.05) v1(38.41,22.78) v1(38.41,15.16) v1(38.41,13.89) v1(38.41,12.62) v1(39.68,27.86) v1(39.68,26.59) v1(39.68,25.32) v1(39.68,24.05) v1(39.68,22.78) v1(39.68,15.16) v1(39.68,13.89) v1(39.68,12.62) v1(40.94,27.86) v1(40.94,26.59) v1(40.94,25.32) v1(40.94,24.05) v1(40.94,22.78) v1(40.94,21.51) v1(40.94,16.43) v1(40.94,15.16) v1(40.94,13.89) v1(40.94,12.62) v1(42.22,27.86) v1(42.22,26.59) v1(42.22,25.32) v1(42.22,24.05) v1(42.22,22.78) v1(42.22,21.51) v1(42.22,20.24) v1(42.22,18.97) v1(42.22,17.7) v1(42.22,16.43) v1(42.22,15.16) v1(42.22,13.89) v1(42.22,12.62) v1(43.48,27.86) v1(43.48,26.59) v1(43.48,25.32) v1(43.48,24.05) v1(43.48,22.78) v1(43.48,21.51) v1(43.48,20.24) v1(43.48,18.97) v1(43.48,17.7) v1(43.48,16.43) v1(43.48,15.16) v1(43.48,13.89) v1(43.48,12.62) v1(44.75,27.86) v1(44.75,26.59) v1(44.75,25.32) v1(44.75,24.05) v1(44.75,22.78) v1(44.75,21.51) v1(44.75,20.24) v1(44.75,18.97) v1(44.75,17.7) v1(44.75,16.43) v1(44.75,15.16) v1(44.75,13.89) v1(44.75,12.62) v1(46.03,27.86) v1(46.03,26.59) v1(46.03,25.32) v1(46.03,24.05) v1(46.03,22.78) v1(46.03,21.51) v1(46.03,20.24) v1(46.03,18.97) v1(46.03,17.7) v1(46.03,16.43) v1(46.03,15.16) v1(46.03,13.89) v1(46.03,12.62) v1(47.29,27.86) v1(47.29,26.59) v1(47.29,25.32) v1(47.29,24.05) v1(47.29,22.78) v1(47.29,21.51) v1(47.29,20.24) v1(47.29,18.97) v1(47.29,17.7) v1(47.29,16.43) v1(47.29,15.16) v1(47.29,13.89) v1(47.29,12.62) v1(48.56,27.86) v1(48.56,26.59) v1(48.56,25.32) v1(48.56,24.05) v1(48.56,22.78) v1(48.56,21.51) v1(48.56,20.24) v1(48.56,18.97) v1(48.56,17.7) v1(48.56,16.43) v1(48.56,15.16) v1(48.56,13.89) v1(48.56,12.62) v1(49.84,27.86) v1(49.84,26.59) v1(49.84,25.32) v1(49.84,24.05) v1(49.84,22.78) v1(49.84,21.51) v1(49.84,20.24) v1(49.84,18.97) v1(49.84,17.7) v1(49.84,16.43) v1(49.84,15.16) v1(49.84,13.89) v1(49.84,12.62) v1(51.1,27.86) v1(51.1,26.59) v1(51.1,25.32) v1(51.1,24.05) v1(51.1,22.78) v1(51.1,21.51) v1(51.1,20.24) v1(51.1,18.97) v1(51.1,17.7) v1(51.1,16.43) v1(51.1,15.16) v1(51.1,13.89) v1(51.1,12.62) v1(52.38,27.86) v1(52.38,26.59) v1(52.38,25.32) v1(52.38,24.05) v1(52.38,22.78) v1(52.38,21.51) v1(52.38,20.24) v1(52.38,18.97) v1(52.38,17.7) v1(52.38,16.43) v1(52.38,15.16) v1(52.38,13.89) v1(52.38,12.62) v1(53.65,27.86) v1(53.65,26.59) v1(53.65,25.32) v1(53.65,24.05) v1(53.65,22.78) v1(53.65,21.51) v1(53.65,20.24) v1(53.65,18.97) v1(53.65,17.7) v1(53.65,16.43) v1(53.65,15.16) v1(53.65,13.89) v1(53.65,12.62) v1(54.91,27.86) v1(54.91,26.59) v1(54.91,25.32) v1(54.91,24.05) v1(54.91,22.78) v1(54.91,21.51) v1(54.91,20.24) v1(54.91,18.97) v1(54.91,17.7) v1(54.91,16.43) v1(54.91,15.16) v1(54.91,13.89) v1(54.91,12.62) v1(56.19,27.86) v1(56.19,26.59) v1(56.19,25.32) v1(56.19,24.05) v1(56.19,22.78) v1(56.19,21.51) v1(56.19,20.24) v1(56.19,18.97) v1(56.19,17.7) v1(56.19,16.43) v1(56.19,15.16) v1(56.19,13.89) v1(56.19,12.62) v1(57.45,27.86) v1(57.45,26.59) v1(57.45,25.32) v1(57.45,24.05) v1(57.45,22.78) v1(57.45,21.51) v1(57.45,20.24) v1(57.45,18.97) v1(57.45,17.7) v1(57.45,16.43) v1(57.45,15.16) v1(57.45,13.89) v1(57.45,12.62) v1(58.72,27.86) v1(58.72,26.59) v1(58.72,25.32) v1(58.72,24.05) v1(58.72,22.78) v1(58.72,21.51) v1(58.72,20.24) v1(58.72,18.97) v1(58.72,17.7) v1(58.72,16.43) v1(58.72,15.16) v1(58.72,13.89) v1(58.72,12.62) v1(60,27.86) v1(60,26.59) v1(60,25.32) v1(60,24.05) v1(60,22.78) v1(60,21.51) v1(60,16.43) v1(60,15.16) v1(60,13.89) v1(60,12.62) v1(61.26,27.86) v1(61.26,26.59) v1(61.26,25.32) v1(61.26,24.05) v1(61.26,22.78) v1(61.26,15.16) v1(61.26,13.89) v1(61.26,12.62) v1(62.53,27.86) v1(62.53,26.59) v1(62.53,25.32) v1(62.53,24.05) v1(62.53,22.78) v1(62.53,15.16) v1(62.53,13.89) v1(62.53,12.62) v1(63.81,27.86) v1(63.81,26.59) v1(63.81,25.32) v1(63.81,24.05) v1(63.81,22.78) v1(63.81,15.16) v1(63.81,13.89) v1(63.81,12.62) v1(65.07,27.86) v1(65.07,26.59) v1(65.07,25.32) v1(65.07,24.05) v1(65.07,22.78) v1(65.07,15.16) v1(65.07,13.89) v1(65.07,12.62) v1(66.34,27.86) v1(66.34,26.59) v1(66.34,25.32) v1(66.34,24.05) v1(66.34,22.78) v1(66.34,21.51) v1(66.34,16.43) v1(66.34,15.16) v1(66.34,13.89) v1(66.34,12.62) v1(67.62,27.86) v1(67.62,26.59) v1(67.62,25.32) v1(67.62,24.05) v1(67.62,22.78) v1(67.62,21.51) v1(67.62,20.24) v1(67.62,18.97) v1(67.62,17.7) v1(67.62,16.43) v1(67.62,15.16) v1(67.62,13.89) v1(67.62,12.62) v1(68.88,27.86) v1(68.88,26.59) v1(68.88,25.32) v1(68.88,24.05) v1(68.88,22.78) v1(68.88,21.51) v1(68.88,20.24) v1(68.88,18.97) v1(68.88,17.7) v1(68.88,16.43) v1(68.88,15.16) v1(68.88,13.89) v1(68.88,12.62) v1(70.16,27.86) v1(70.16,26.59) v1(70.16,25.32) v1(70.16,24.05) v1(70.16,22.78) v1(70.16,21.51) v1(70.16,20.24) v1(70.16,18.97) v1(70.16,17.7) v1(70.16,16.43) v1(70.16,15.16) v1(70.16,13.89) v1(70.16,12.62) v1(71.43,27.86) v1(71.43,26.59) v1(71.43,25.32) v1(71.43,24.05) v1(71.43,22.78) v1(71.43,21.51) v1(71.43,20.24) v1(71.43,18.97) v1(71.43,17.7) v1(71.43,16.43) v1(71.43,15.16) v1(71.43,13.89) v1(71.43,12.62) v1(72.24,63.17) v1(72.69,27.86) v1(72.69,26.59) v1(72.69,25.32) v1(72.69,24.05) v1(72.69,22.78) v1(72.69,21.51) v1(72.69,20.24) v1(72.69,18.97) v1(72.69,17.7) v1(72.69,16.43) v1(72.69,15.16) v1(72.69,13.89) v1(72.69,12.62) v1(72.77,63.17) v1(73.3,63.17) v1(73.97,27.86) v1(73.97,26.59) v1(73.97,25.32) v1(73.97,24.05) v1(73.97,22.78) v1(73.97,21.51) v1(73.97,20.24) v1(73.97,18.97) v1(73.97,17.7) v1(73.97,16.43) v1(73.97,15.16) v1(73.97,13.89) v1(73.97,12.62) v1(75.23,27.86) v1(75.23,26.59) v1(75.23,25.32) v1(75.23,24.05) v1(75.23,22.78) v1(75.23,21.51) v1(75.23,20.24) v1(75.23,18.97) v1(75.23,17.7) v1(75.23,16.43) v1(75.23,15.16) v1(75.23,13.89) v1(75.23,12.62) v1(76.5,27.86) v1(76.5,26.59) v1(76.5,25.32) v1(76.5,24.05) v1(76.5,22.78) v1(76.5,21.51) v1(76.5,20.24) v1(76.5,18.97) v1(76.5,17.7) v1(76.5,16.43) v1(76.5,15.16) v1(76.5,13.89) v1(76.5,12.62) v1(77.78,27.86) v1(77.78,26.59) v1(77.78,25.32) v1(77.78,24.05) v1(77.78,22.78) v1(77.78,21.51) v1(77.78,20.24) v1(77.78,18.97) v1(77.78,17.7) v1(77.78,16.43) v1(77.78,15.16) v1(77.78,13.89) v1(77.78,12.62) v1(79.04,27.86) v1(79.04,26.59) v1(79.04,25.32) v1(79.04,24.05) v1(79.04,22.78) v1(79.04,21.51) v1(79.04,20.24) v1(79.04,18.97) v1(79.04,17.7) v1(79.04,16.43) v1(79.04,15.16) v1(79.04,13.89) v1(79.04,12.62) v1(80.31,27.86) v1(80.31,26.59) v1(80.31,25.32) v1(80.31,24.05) v1(80.31,22.78) v1(80.31,21.51) v1(80.31,20.24) v1(80.31,18.97) v1(80.31,17.7) v1(80.31,16.43) v1(80.31,15.16) v1(80.31,13.89) v1(80.31,12.62) v1(81.59,27.86) v1(81.59,26.59) v1(81.59,25.32) v1(81.59,24.05) v1(81.59,22.78) v1(81.59,21.51) v1(81.59,20.24) v1(81.59,18.97) v1(81.59,17.7) v1(81.59,16.43) v1(81.59,15.16) v1(81.59,13.89) v1(81.59,12.62) v1(82.85,27.86) v1(82.85,26.59) v1(82.85,25.32) v1(82.85,24.05) v1(82.85,22.78) v1(82.85,21.51) v1(82.85,20.24) v1(82.85,18.97) v1(82.85,17.7) v1(82.85,16.43) v1(82.85,15.16) v1(82.85,13.89) v1(82.85,12.62) v1(84.12,27.86) v1(84.12,26.59) v1(84.12,25.32) v1(84.12,24.05) v1(84.12,22.78) v1(84.12,21.51) v1(84.12,16.43) v1(84.12,15.16) v1(84.12,13.89) v1(84.12,12.62) v1(85.4,27.86) v1(85.4,26.59) v1(85.4,25.32) v1(85.4,24.05) v1(85.4,22.78) v1(85.4,15.16) v1(85.4,13.89) v1(85.4,12.62) v1(86.66,27.86) v1(86.66,26.59) v1(86.66,25.32) v1(86.66,24.05) v1(86.66,13.89) v1(86.66,12.62) v1(87.94,27.86) v1(87.94,26.59) v1(87.94,25.32) v1(87.94,24.05) v1(87.94,13.89) v1(87.94,12.62) v1(89.2,27.86) v1(89.2,26.59) v1(89.2,25.32) v1(89.2,24.05) v1(89.2,13.89) v1(89.2,12.62) v1(90.47,27.86) v1(90.47,26.59) v1(90.47,25.32) v1(90.47,24.05) v1(90.47,22.78) v1(90.47,13.89) v1(90.47,12.62) v1(91.75,27.86) v1(91.75,26.59) v1(91.75,25.32) v1(91.75,24.05) v1(91.75,22.78) v1(91.75,15.16) v1(91.75,13.89) v1(91.75,12.62) v1(93.01,27.86) v1(93.01,26.59) v1(93.01,25.32) v1(93.01,24.05) v1(93.01,22.78) v1(93.01,21.51) v1(93.01,20.24) v1(93.01,18.97) v1(93.01,17.7) v1(93.01,16.43) v1(93.01,15.16) v1(93.01,13.89) v1(93.01,12.62) v1(94.28,27.86) v1(94.28,26.59) v1(94.28,25.32) v1(94.28,24.05) v1(94.28,22.78) v1(94.28,21.51) v1(94.28,20.24) v1(94.28,18.97) v1(94.28,17.7) v1(94.28,16.43) v1(94.28,15.16) v1(94.28,13.89) v1(94.28,12.62) v1(95.56,27.86) v1(95.56,26.59) v1(95.56,25.32) v1(95.56,24.05) v1(95.56,22.78) v1(95.56,21.51) v1(95.56,20.24) v1(95.56,18.97) v1(95.56,17.7) v1(95.56,16.43) v1(95.56,15.16) v1(95.56,13.89) v1(95.56,12.62) v1(96.82,27.86) v1(96.82,26.59) v1(96.82,25.32) v1(96.82,24.05) v1(96.82,22.78) v1(96.82,21.51) v1(96.82,20.24) v1(96.82,18.97) v1(96.82,17.7) v1(96.82,16.43) v1(96.82,15.16) v1(96.82,13.89) v1(96.82,12.62) v1(98.09,27.86) v1(98.09,26.59) v1(98.09,25.32) v1(98.09,24.05) v1(98.09,22.78) v1(98.09,21.51) v1(98.09,20.24) v1(98.09,18.97) v1(98.09,17.7) v1(98.09,16.43) v1(98.09,15.16) v1(98.09,13.89) v1(98.09,12.62) v2(38.19,18.77) v2(63.19,18.77) v3(13.19,18.77) v3(88.19,18.77) v4(3.84,31.27)
MOS_G:
  vias: v5(44.05,62.77)
$1N10367:
  vias: v1(17.53,42.52) v1(38.23,60.17)
$1N10753:
  vias: v1(29.21,42.52) v1(39.88,60.17)
$1N10869:
  vias: v1(40.77,42.65) v1(41.4,60.17)
$1N10985:
  vias: v1(43.05,60.17) v1(52.45,42.52)
$1N11101:
  vias: v1(50.29,60.17) v1(64.13,42.52)
$1N11217:
  vias: v1(51.94,60.17) v1(76.17,42.55)
$1N64306:
  vias: v1(53.65,60.12) v1(87.5,42.52)
$1N64637:
  vias: v1(55.37,60.17) v1(97.92,42.65)

## Copper pours and planes (outline as drawn; the poured copper is in the pictures)
GND on Top Layer: 44.32,61.7 49.22,61.7 49.22,54.84 44.32,54.84
GND on Top Layer: 0.51,39.47 15.42,39.47 15.43,39.46 15.43,43.92 18.8,43.92 18.8,39.47 26.98,39.47 26.99,39.46 26.99,43.92 30.52,43.92 30.52,39.34 38.86,39.34 38.86,43.79 42.29,43.79 42.29,39.34 50.46,39.34 50.48,39.36 50.48,43.71 53.85,43.79 53.97,43.79 53.97,39.47 61.98,39.47 62.04,39.41 62.1,39.47 62.1,43.79 65.53,43.79 65.53,39.34 73.79,39.34 73.79,43.79 77.3,43.79 77.3,39.38 85.38,39.38 85.47,39.47 85.47,43.79 89.03,43.79 89.03,39.34 97.03,39.34 97.16,39.47 97.16,43.79 100.44,43.79 100.45,43.8 100.45,56.86 100.46,56.87 0.38,56.87 0.38,39.6
GND on Bottom Layer: 2.16,45.57 15.06,45.57 15.06,39.86 2.16,39.86
MOS_D on Top Layer: 1.4,33.88 -2.41,33.88 -2.41,11.05 114.05,11.05 114.05,32.11 108.33,37.82 5.33,37.82
MOS_D on Top Layer: 72.01,63.5 73.53,63.5 73.53,59.03 72.01,59.03
MOS_D on Bottom Layer: 2.02,37.69 107.7,37.69 107.7,10.97 2.02,10.97

## Text on the board
Top Layer: 蜗牛点焊机MOS板 V1.0A
Top Solder Mask Layer: 蜗牛点焊机MOS板 V1.0A
Top Silkscreen Layer: ⬆此处接焊笔负极 | ⬇此处接超级电容负极 | D G S
